# Altium project PCB_WackyRacers.PrjPcb
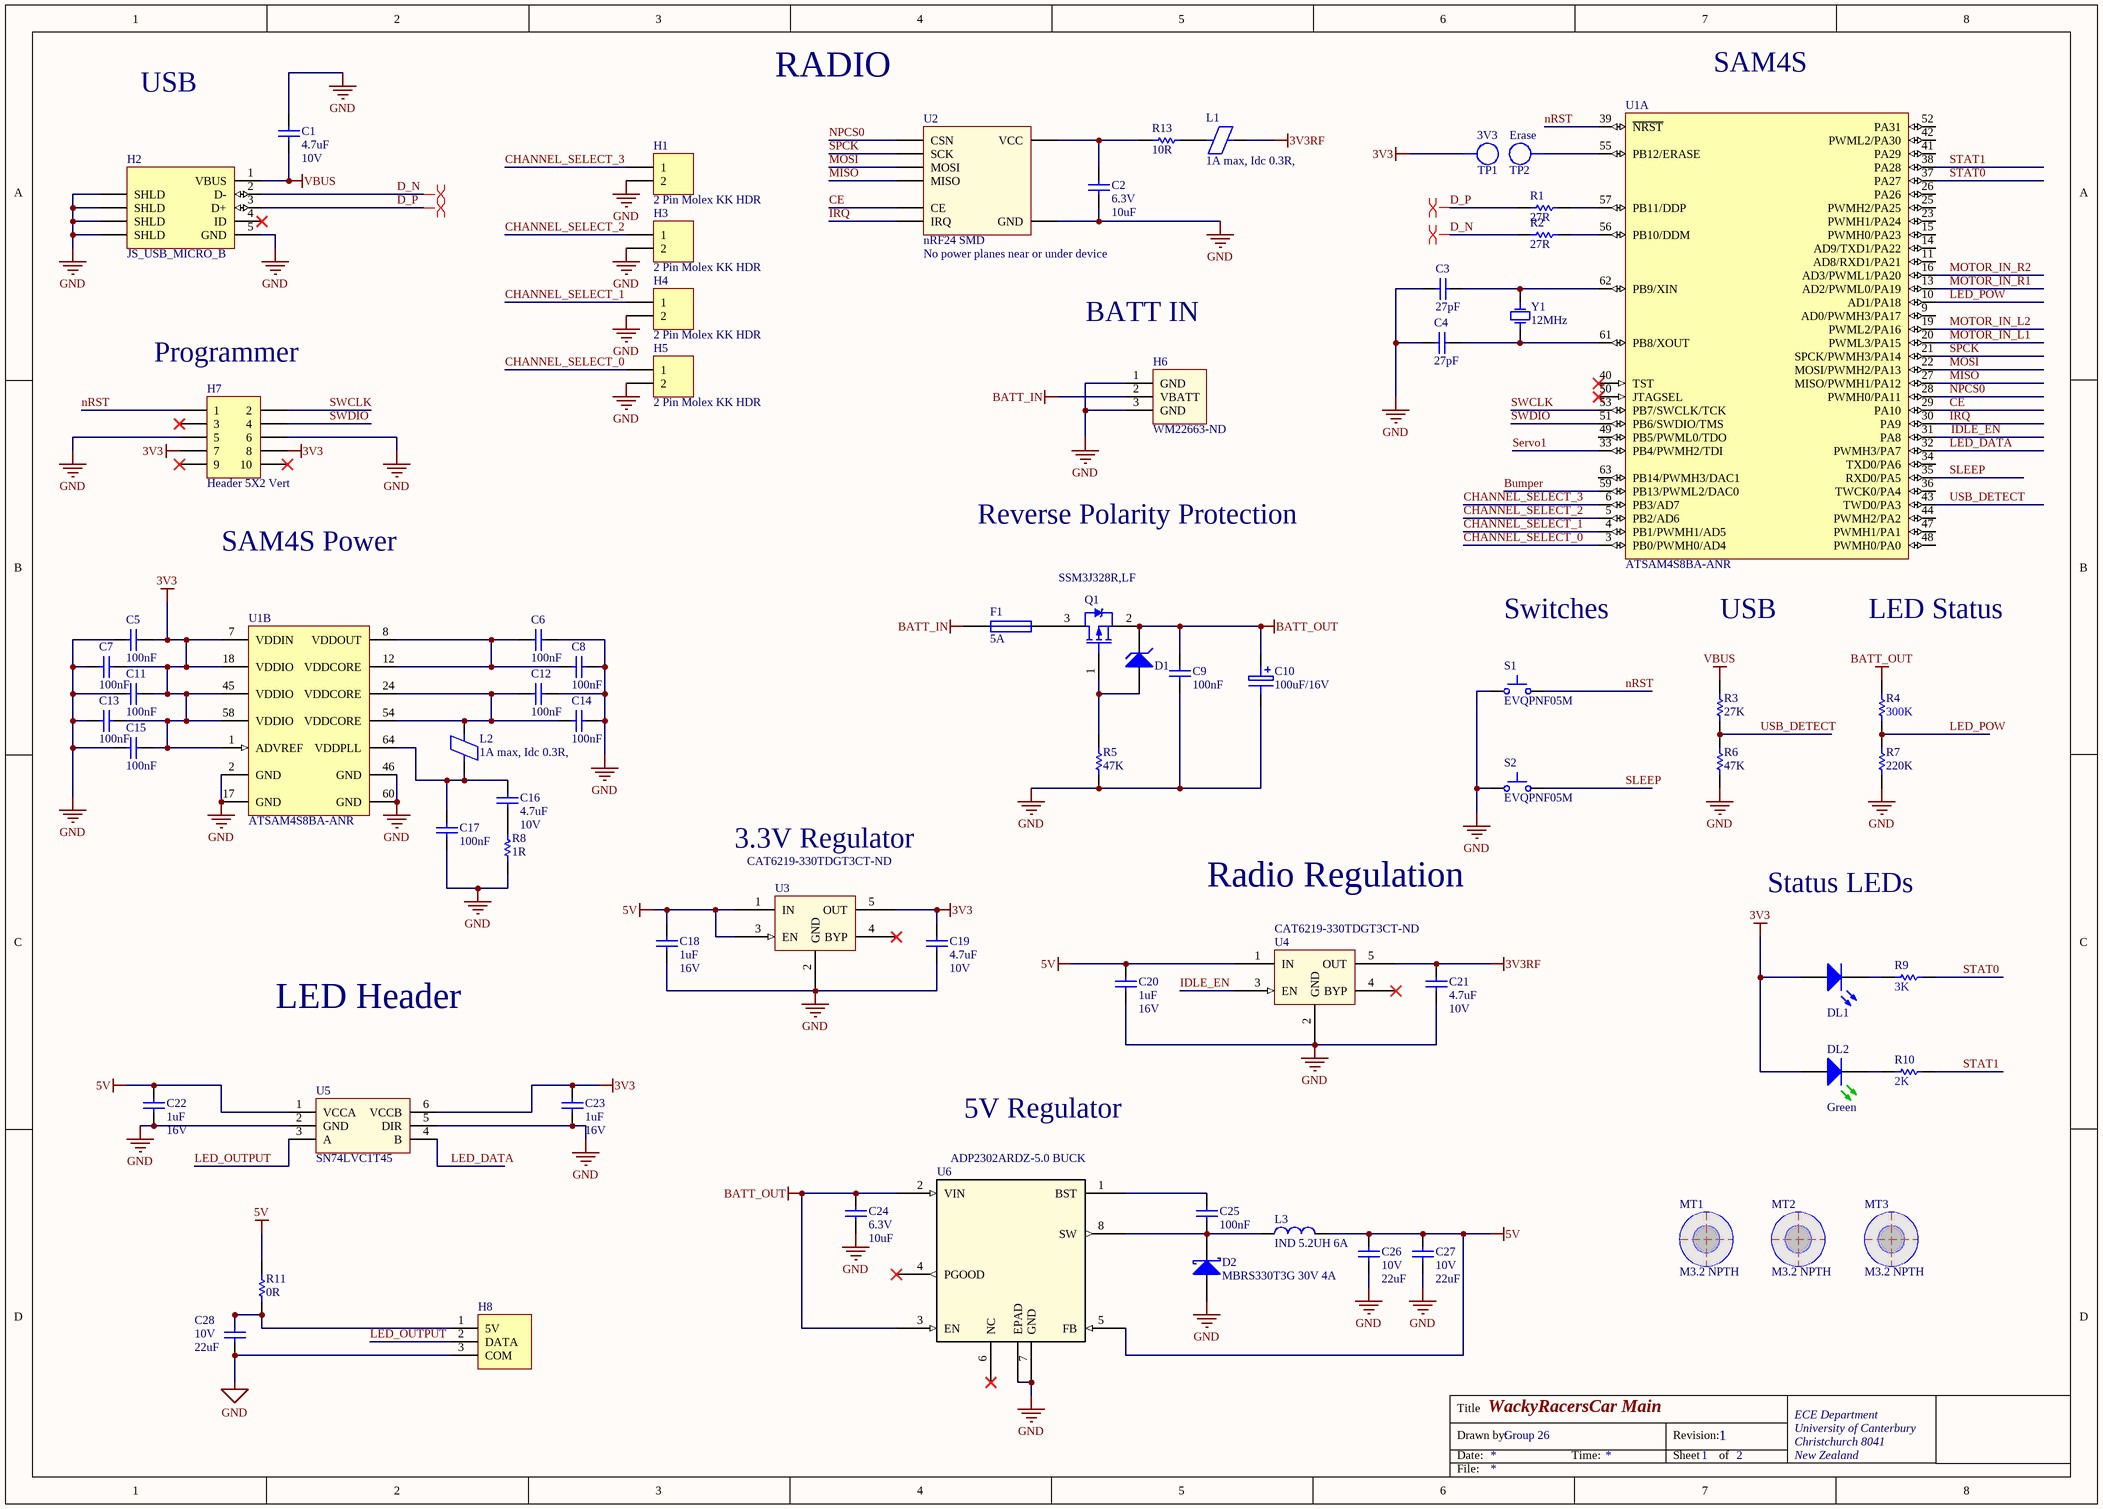
[diagram p0: Schematic_Car_Main.SchDoc]
2 sheets, 98 parts. Net scope: global (net labels, ports and power ports of the same name join across sheets).
Board file: DominicMcNulty_Car_PCB_Group26.PcbDoc
Sheets:
  Schematic_Car_Main.SchDoc
  Schematic_Car_Secondary.SchDoc

## Sheet Schematic_Car_Main.SchDoc: WackyRacersCar Main
size A3; DrawnBy: Group 26; Address1: ECE Department; Address2: University of Canterbury; Address3: Christchurch 8041; Address4: New Zealand; Revision: 1; SheetNumber: 1; SheetTotal: 2; ImagePath: \\maxwell\elecapp\AltiumDesigner\Templates\uc-logo.png

### Parts
C1  Max Voltage: 10V  [CAPC1608N]  (hidden comment: 4.7uF)
C2  Voltage - Rated: 6.3V  [CAPC1608L]  (hidden comment: 10uF)
C3  27pF  [CAPC1608L]
C4  27pF  [CAPC1608L]
C5  100nF  [CAPC1608L]
C6  100nF  [CAPC1608L]
C7  100nF  [CAPC1608L]
C8  100nF  [CAPC1608L]
C9  100nF  [CAPC1608L]
C10  100uF/16V  [NICH-1]
C11  100nF  [CAPC1608L]
C12  100nF  [CAPC1608L]
C13  100nF  [CAPC1608L]
C14  100nF  [CAPC1608L]
C15  100nF  [CAPC1608L]
C16  Max Voltage: 10V  [CAPC1608N]  (hidden comment: 4.7uF)
C17  100nF  [CAPC1608L]
C18  Max Voltage: 16V  [CAPC1608L]  (hidden comment: 1uF)
C19  Max Voltage: 10V  [CAPC1608N]  (hidden comment: 4.7uF)
C20  Max Voltage: 16V  [CAPC1608L]  (hidden comment: 1uF)
C21  Max Voltage: 10V  [CAPC1608N]  (hidden comment: 4.7uF)
C22  Max Voltage: 16V  [CAPC1608L]  (hidden comment: 1uF)
C23  Max Voltage: 16V  [CAPC1608L]  (hidden comment: 1uF)
C24  Voltage - Rated: 6.3V  [CAPC1608L]  (hidden comment: 10uF)
C25  100nF  [CAPC1608L]
C26  Max Voltage: 10V  [CAPC3216L]  (hidden comment: 22uF)
C27  Max Voltage: 10V  [CAPC3216L]  (hidden comment: 22uF)
C28  Max Voltage: 10V  [CAPC3216L]  (hidden comment: 22uF)
D1  DIODE ZENER 5.6V  [DO-214AA_SCL]  (value not drawn)
D2  MBRS330T3G 30V 4A  [SMC]
DL1  DL_LED3mm  [LED3MMTH]  (value not drawn)
DL2  Green  [WL-SMCW0603]
F1  5A  [RESC3216N]
H1  2 Pin Molex KK HDR  [MOLEX_KK_2_HDR]
H2  JS_USB_MICRO_B  [FCI_USB_10118194-0001LF]
H3  2 Pin Molex KK HDR  [MOLEX_KK_2_HDR]
H4  2 Pin Molex KK HDR  [MOLEX_KK_2_HDR]
H5  2 Pin Molex KK HDR  [MOLEX_KK_2_HDR]
H6  Supplier Part Number 1: WM22663-ND  [BATT_HEADER_3POS]  (hidden comment: Battery_HEADER_3pin)
H7  Header 5X2 Vert  [IDC2.54-V10D]
H8  3 Pin Molex KK Hdr  [MOLEX_KK_3_HDR]  (value not drawn)
L1  1A max, Idc 0.3R,  [INDC3216L]
L2  1A max, Idc 0.3R,  [INDC3216L]
L3  IND 5.2UH 6A  [INDUCTOR5u2]
MT1  M3.2 NPTH  [MNT-HOLE_3.2mm_NPTH]  (no BOM)
MT2  M3.2 NPTH  [MNT-HOLE_3.2mm_NPTH]  (no BOM)
MT3  M3.2 NPTH  [MNT-HOLE_3.2mm_NPTH]  (no BOM)
Q1  SSM3J328R,LF  [SOT23_L]
R1  27R  [RESC1608L]
R2  27R  [RESC1608L]
R3  27K  [RESC1608L]
R4  300K  [RESC1608L]
R5  47K  [RESC1608N]
R6  47K  [RESC1608N]
R7  220K  [RESC1608L]
R8  1R  [RESC3216L]
R9  3K  [RESC1608L]
R10  2K  [RESC1608L]
R11  0R  [RESC1608L]
R13  10R  [RESC1608L]
S1  EVQPNF05M  [EVQPNF05M]
S2  EVQPNF05M  [EVQPNF05M]
TP1  3V3  [TP_1206]  (no BOM)
TP2  Erase  [TP_1206]  (no BOM)
U1  ATSAM4S8BA-ANR  [LQFP64_L]  (parts A,B of 2)
U2  nRF24 SMD  Warning: No power planes near or under device  [NRF24]
U3  Supplier Part Number: CAT6219-330TDGT3CT-ND  [SOT95P280X145-5N]  (hidden comment: CAT6219-330TDGT3)
U4  Supplier Part Number: CAT6219-330TDGT3CT-ND  [SOT95P280X145-5N]  (hidden comment: CAT6219-330TDGT3)
U5  SN74LVC1T45  [SOT23-6_N]
U6  ADP2302ARDZ-5.0 BUCK  [RD_8_1]
Y1  12MHz  [6.0X3.5-4]

### Nets
3V3: C5.2 C7.2 C11.2 C13.2 C15.2 C19.2 C23.2 DL1.2(A) DL2.2(A) H7.7 H7.8 TP1.1 U1.1(ADVREF) U1.7(VDDIN) U1.18(VDDIO) U1.45(VDDIO) U1.58(VDDIO) U3.5(OUT) U5.6(VCCB)
3V3RF: C21.2 L1.2 U4.5(OUT)
5V: C18.2 C20.2 C22.2 C26.2 C27.2 L3.2 R11.2 U3.1(IN) U3.3(EN) U4.1(IN) U5.1(VCCA) U6.5(FB)
BATT_IN: F1.1 H6.2(VBATT)
BATT_OUT: C9.2 C10.2 C24.2 D1.1(K) Q1.2 R4.2 U6.2(VIN) U6.3(EN)
GND: C1.2 C2.1 C3.1 C4.1 C5.1 C6.1 C7.1 C8.1 C9.1 C10.1 C11.1 C12.1 C13.1 C14.1 C15.1 C17.1 C18.1 C19.1 C20.1 C21.1 C22.1 C23.1 C24.1 C26.1 C27.1 C28.1 D2.1(A) H1.2 H2.5(GND) H2.6(SHLD) H3.2 H4.2 H5.2 H6.1(GND) H6.3(GND) H7.5 H7.6 H8.3(COM) R5.1 R6.1 R7.1 R8.1 S1.1 S2.1 U1.2(GND) U1.17(GND) U1.46(GND) U1.60(GND) U2.2(GND) U3.2(GND) U4.2(GND) U5.2(GND) U5.5(DIR) U6.7(GND) U6.EPAD
VBUS: C1.1 H2.1(VBUS) R3.2
Bumper: U1.59(PB13/PWML2/DAC0)
CE: U1.29(PA10) U2.3(CE)
CHANNEL_SELECT_0: H5.1 U1.3(PB0/PWMH0/AD4)
CHANNEL_SELECT_1: H4.1 U1.4(PB1/PWMH1/AD5)
CHANNEL_SELECT_2: H3.1 U1.5(PB2/AD6)
CHANNEL_SELECT_3: H1.1 U1.6(PB3/AD7)
D_N: H2.2(D-) R2.1
D_P: H2.3(D+) R1.1
IDLE_EN: U1.31(PA8) U4.3(EN)
IRQ: U1.30(PA9) U2.8(IRQ)
LED_DATA: U1.32(PWMH3/PA7) U5.4(B)
LED_OUTPUT: H8.2(DATA) U5.3(A)
LED_POW: R4.1 R7.2 U1.10(AD1/PA18)
MISO: U1.27(MISO/PWMH1/PA12) U2.7(MISO)
MOSI: U1.22(MOSI/PWMH2/PA13) U2.6(MOSI)
MOTOR_IN_L1: U1.20(PWML3/PA15)
MOTOR_IN_L2: U1.19(PWML2/PA16)
MOTOR_IN_R1: U1.13(AD2/PWML0/PA19)
MOTOR_IN_R2: U1.16(AD3/PWML1/PA20)
NPCS0: U1.28(PWMH0/PA11) U2.4(CSN)
nRST: H7.1 S1.2 U1.39(~{NRST})
Servo1: U1.33(PB4/PWMH2/TDI)
SLEEP: S2.2 U1.35(RXD0/PA5)
SPCK: U1.21(SPCK/PWMH3/PA14) U2.5(SCK)
STAT0: R9.2 U1.37(PA27)
STAT1: R10.2 U1.38(PA28)
SWCLK: H7.2 U1.53(PB7/SWCLK/TCK)
SWDIO: H7.4 U1.51(PB6/SWDIO/TMS)
USB_DETECT: R3.1 R6.2 U1.43(TWD0/PA3)
NetC2_2: C2.2 R13.1 U2.1(VCC)
NetC3_2: C3.2 U1.62(PB9/XIN) Y1.3(OSC2)
NetC4_2: C4.2 U1.61(PB8/XOUT) Y1.1(OSC1)
NetC6_2: C6.2 C8.2 U1.8(VDDOUT) U1.12(VDDCORE)
NetC12_2: C12.2 C14.2 L2.2 U1.24(VDDCORE) U1.54(VDDCORE)
NetC16_1: C16.1 R8.2
NetC16_2: C16.2 C17.2 L2.1 U1.64(VDDPLL)
NetC25_1: C25.1 D2.2(K) L3.1 U6.8(SW)
NetC25_2: C25.2 U6.1(BST)
NetC28_2: C28.2 H8.1(5V) R11.1
NetD1_2: D1.2(A) Q1.1 R5.2
NetDL1_1: DL1.1(K) R9.1
NetDL2_1: DL2.1(K) R10.1
NetF1_2: F1.2 Q1.3
NetL1_1: L1.1 R13.2
NetR1_2: R1.2 U1.57(PB11/DDP)
NetR2_2: R2.2 U1.56(PB10/DDM)
NetTP2_1: TP2.1 U1.55(PB12/ERASE)

Not connected (* = marked no-connect by the designer): H2 4(ID)*; H7 3* 9* 10*; U1 9(AD0/PWMH3/PA17) 11(AD8/RXD1/PA21) 14(AD9/TXD1/PA22) 15(PWMH0/PA23) 23(PWMH1/PA24) 25(PWMH2/PA25) 26(PA26) 34(TXD0/PA6) 36(TWCK0/PA4) 40(TST)* 41(PA29) 42(PWML2/PA30) 44(PWMH2/PA2) 47(PWMH1/PA1) 48(PWMH0/PA0) 49(PB5/PWML0/TDO) 50(JTAGSEL)* 52(PA31) 63(PB14/PWMH3/DAC1); U3 4(BYP)*; U4 4(BYP)*; U6 4(PGOOD)* 6(NC)*

### Layout directives
differential pair: D_N, D_P

### Notes on the sheet
- USB
- RADIO
- (near U1) SAM4S
- (near H7) Programmer
- BATT IN
- SAM4S Power
- Reverse Polarity Protection
- Switches
- LED Status
- 3.3V Regulator
- Radio Regulation
- Status LEDs
- LED Header
- 5V Regulator
- Title
- Drawn by:
- Date:
- Time:
- Revision:
- Sheet
- of
- File:

### Library data of the parts
C1 C16 C19 C21 = CC_4.7uF_0603: CAP CER 4.7uF X5R +-20%  10V 0603; Note: Footprint corresponds to dimensions for bulk cassette packaging. This case size has tightened tolerances.; PackageReference: 0805; Code_IPC: 2012[0805]; Verify: *; Supplier: ECE Dept; Storage Location: PCB Assembly WS; Value: 4.7uF
C2 C24 = CC_10uF_0603: CAP CER 10UF X5R +-20% 6V3 0603; Supplier: ECE Dept; Storage Location: PCB Assembly WS; Value: 10uF
C3 C4 = CC_27pF_0603: CAP CER 27pF NPO/COG +-5% 50V 0603; PackageReference: 0603; Code_IPC: 1608 [0603]; Verify: *; Supplier: ECE Dept; Storage Location: PCB Assembly WS; Value: 27pF
C5-C9 C11-C15 C17 C25 = CC_100nF_0603: CAP CER 100nF X7R +-10% 50V 0603; PackageReference: 0603; Code_IPC: 1608 [0603]; Verify: *; Supplier: ECE Dept; Storage Location: PCB Assembly WS; Value: 100nF
C10 = CA_100uF_16V: CAP ALUM 100uF 16V SMD; Manufacturer PN: UWX1C101MCL1GB; Manufacturer: Nichcon; Supplier 1: Farnell; Supplier Part Number 1: 1870677; Storage Location: PCB Assembly WS; Supplier: ECE Dept; Supplier 2: Digi-Key; Supplier Part Number 2: 493-2105-1-ND; Value: 100uF/16V
C18 C20 C22 C23 = CC_1uF_0603: CAP CER 1uF Y5V -20% +80% 16V 0603; PackageReference: 0603; Code_IPC: 1608 [0603]; Verify: *; Supplier: ECE Dept; Storage Location: PCB Assembly WS; Value: 1uF
C26-C28 = CC_22uF_1206: CAP CER 22uF Y5V -20% +80% 10V 1206; Verify: *; Supplier: ECE Dept; Storage Location: PCB Assembly WS; Dielectric: Y5V; Footprint: 1206 (3216 metric); Value: 22uF
D1 = SMBJ5339B-TP: DIODE ZENER 5.6V 5W DO214AA; Manufacturer: Micro Commercial Co; Tolerance: ±5%; Supplier 1: Digi-Key; Manufacturer Part Number: SMBJ5339B-TP; RoHS: RoHS Compliant; Category: Discrete Semiconductor Products; Stock 1: 85990; Pricing 1: 1=1.47, 10=1.277, 25=1.1312, 100=0.9853, 250=0.85764, 500=0.72988, 1000=0.58391 (NZD); Packaging: Cut Tape (CT); Part Status: Active; Operating Temperature: -55°C ~ 150°C; Mounting Type: Surface Mount; Package / Case: DO-214AA, SMB; Supplier Device Package: DO-214AA (SMB); Base Part Number: SMBJ5339; ComponentLink1URL: http://www.mccsemi.com/up_pdf/SMBJ5338B-SMBJ5388B(SMB).pdf; ComponentLink1Description: http://www.mccsemi.com/up_pdf/SMBJ5338B-SMBJ5388B(SMB).pdf; Supplier Part Number 1: SMBJ5339B-TPMSCT-ND
D2 = MBRS330T3G: SCHOTTKY  30V 4A; Manufacturer: ON Semiconductor; Speed: Fast Recovery =< 500ns, > 200mA (Io); Supplier 1: Digi-Key; Manufacturer Part Number: MBRS330T3G; RoHS: RoHS Compliant; Category: Discrete Semiconductor Products; Stock 1: 8919; Pricing 1: 1=0.93, 10=0.79, 100=0.5902, 500=0.46368, 1000=0.35829 (NZD); Packaging: Cut Tape (CT); Part Status: Active; Diode Type: Schottky; Current - Average Rectified (Io): 4A; Capacitance @ Vr, F: -; Mounting Type: Surface Mount; Package / Case: DO-214AB, SMC; Supplier Device Package: SMC; Operating Temperature - Junction: -65°C ~ 150°C; Base Part Number: MBRS330; ComponentLink1URL: http://www.onsemi.com/pub/Collateral/MBRS340T3-D.PDF; ComponentLink1Description: http://www.onsemi.com/pub/Collateral/MBRS340T3-D.PDF; Supplier Part Number 1: MBRS330T3GOSCT-ND
DL1 = DL_LED3mm: LED 3mm Dia Thru Hole; Storage Location: ECE Store; Supplier 1: Farnell; Supplier Part Number 1: 1497967; Supplier: ECE Dept
DL2 = DL_150060GS75000: LED Green 430mcd 0603 SMD; Manufacturer: WURTH ELEKTRONIK; Forward Current If: 30; Wavelength Typ: 520; Forward Voltage: 3.2; Lens Shape: Rectangular; Luminous Intensity: 430; Viewing Angle: 140°; LED Mounting: SMD; Supplier 1: Farnell; Supplier Part Number 1: 2322070; Manufacturer Part Number: 150060GS75000; Storage Location: PCB Assembly WS; Supplier: ECE Dept; LED Colour: Green
F1 = FS_Fuse_5.0A: Fuse 5.0A Fast Acting 1206 SMD; Manufacturer Part Number: C1F5; Manufacturer: Bel TRP; Voltage Rating (AC): 125V; Voltage Rating (DC): 63V; DC Cold Resistance: 19mR; Fuse Type: Board Mount (Cartridge Style Excluded); Approvals: CE,cURus; Mount: Surface Mount; Case/Package: 1206; Number of Pins: 2; Case Code (Metric): 3216; Case Code (Imperial): 1206; Contact Plating: Nickel,Tin; Min Operating Temperature: -55°C; Max Operating Temperature: 125°C; Packaging: Tape and Reel; Voltage Rating: 125V; Length: 0.126inch; Width: 0.062inch; Supplier 1: Digi-Key; Stock 1: 725; Pricing 1: 1=0.32, 5=0.312, 10=0.298, 50=0.2662, 100=0.2479, 250=0.22032, 500=0.1836, 1000=0.17442 (USD); ComponentLink1URL: http://www.farnell.com/datasheets/2571625.pdf; ComponentLink1Description: http://www.farnell.com/datasheets/2571625.pdf; ComponentLink2URL: http://belfuse.com/pdfs/C1F.pdf; ComponentLink2Description: http://belfuse.com/pdfs/C1F.pdf; ComponentLink3URL: http://www.mouser.com/ds/2/643/C1F-594910.pdf; ComponentLink3Description: http://www.mouser.com/ds/2/643/C1F-594910.pdf; ComponentLink4URL: https://belfuse.com/resources/StewartConnector/C1F.pdf; ComponentLink4Description: https://belfuse.com/resources/StewartConnector/C1F.pdf; Current Rating: 5A; Supplier Part Number 1: 507-1886-1-ND; Supplier 2: Element14; Supplier Part Number 2: 2848595; Value: 5A
H1 H3-H5 = JA_MOLEX_KK_2POS: CONN HEADER 2POS 2.54mm VERT_Thru Hole; Supplier 1: Farnell; Supplier Part Number 1: 1462926; Supplier: ECE Dept; Storage Location: ECE Dept Store; Value: 2 Pin Molex KK HDR
H2 = JS_USB_MICRO_B_SMT: CONN USB MICRO B RECPT SMT R/A; Manufacturer: FCI; Manufacturer Part Number: 10118194-0001LF; Gender: Receptacle; Number of Contacts: 5; Specifications: USB 2.0; Supplier 1: Digi-Key; Supplier Part Number 1: 609-4618-1-ND; Features: Shielded, Solder Retention; Mounting Type: Surface Mount, Right Angle, Horizontal
H6 = Battery_HEADER_3pin: 3Pin Header 2.54mm spacing / Digikey #WM22663-ND; Supplier 1: Digi-Key
H7 = JA_HDR_IDC_5X2_VERT: IDC Header, 2,54mm, 10-Pin, Vert; Supplier: ECE Dept; Supplier 1: Farnell; Supplier Part Number 1: 1096985; Storage Location: ECE Dept Store
H8 = LED_Strip_Header: CONN HEADER 3POS 2.54mm VERT_Thru Hole; Manufacturer: Molex; Manufacturer PN: 22-23-2031; Supplier Part Number 1: 9731156; Supplier: ECE Dept; Supplier 1: Farnell; Storage Location: ECE Dept Store; Value: 3 Pin Molex KK Hdr
L1 L2 = IN_Ferrite-Bead: Ferrite Bead, Rdc 0.3R, Z100MHZ 600R, Imax 1A, SMD 1206; Manufacturer: FAIR-RITE; Manufacturer PN: 2512066017Y1; DC Current Rating: 1; DC Resistance Max: 0.08; Ferrite Case Style: 1206 ^3216 Metric]; Frequency Range: 50MHz to 1; Impedance: 600; Impedance Tolerance: ± 25%; Supplier: ECE Dept; Storage Location: PCB Assembly WS; Ferrite Mounting: SMD; Supplier 1: Farnell; Supplier Part Number 1: 1612060; Manufacturer Part Number: 2512066017Y1; Value: 1A max, Idc 0.3R,
L3 = CDRH104RNP-5R2NC: FIXED IND 5.2UH 6A 22 MOHM SMD; Manufacturer: Sumida America Components Inc.; Material - Core: Ferrite; Tolerance: ±30%; Current - Saturation: 5.6A; Shielding: Shielded; DC Resistance (DCR): 22 mOhm Max; Supplier 1: Digi-Key; Manufacturer Part Number: CDRH104RNP-5R2NC; RoHS: RoHS Compliant; Category: Inductors, Coils, Chokes; Stock 1: 3849; Pricing 1: 1=2.9, 10=2.678, 100=1.8743, 500=1.5173 (NZD); Packaging: Cut Tape (CT); Part Status: Active; Type: -; Q @ Freq: -; Frequency - Self Resonant: -; Ratings: -; Operating Temperature: -40°C ~ 100°C; Mounting Type: Surface Mount; Package / Case: Nonstandard; Supplier Device Package: -; Size / Dimension: 0.402" L x 0.394" W (10.20mm x 10.00mm); Height - Seated (Max): 0.157" (4.00mm); ComponentLink1URL: http://products.sumida.com/products/pdf/CDRH104R.pdf; ComponentLink1Description: http://products.sumida.com/products/pdf/CDRH104R.pdf; Supplier Part Number 1: 308-2280-1-ND
MT1-MT3 = MC_M3.2_HOLE: Fixing M3.2 Mount Hole NPTH; Manufacturer: Hi-Q; Manufacturer PN: 3BV series M3 Clearance; price: 0; Supplier: ECE Dept; value: M3.2 NPTH
Q1 = TM_SSM3J328R: MOSFET P-CH 20V 6A SOT23-3; Manufacturer: Toshiba; FET Feature: Logic Level Gate, 1.5V Drive; FET Type: MOSFET P-Channel, Metal Oxide; Gate Charge (Qg) @ Vgs: 12.8nC @ 4.5V; Input Capacitance (Ciss) @ Vds: 840pF @ 10V; Power - Max: 1W; Rds On Max: 29.8mR; Drain to Source Resistance: 47.4mR; Turn-On Delay Time: 32ns; Power Dissipation: 2W; Number of Channels: 1; Turn-Off Delay Time: 107ns; Gate to Source Voltage (Vgs): 8V; Input Capacitance: 840pF; Element Configuration: Single; Drain to Source Breakdown Voltage: -20V; Vgs(th) (Max) @ Id: 1V @ 1mA; Current - Continuous Drain (Id) @ 25° C: 6A; Drain to Source Voltage (Vdss): 20V; Package / Case: SOT-23-3 Flat Leads; Supplier Device Package: SOT-23F; Pricing: 1=0.79, 10=0.658, 25=0.5772, 100=0.4939, 250=0.42836, 500=0.36284, 1000=0.27972 (NZD); Storage Location: PCB Assembly WS; Supplier: Digi-Key; ComponentLink1URL: https://datasheet.ciiva.com/11158/ssm3j328r-datasheet-en-20140301-11158652.pdf; ComponentLink1Description: https://datasheet.ciiva.com/11158/ssm3j328r-datasheet-en-20140301-11158652.pdf; Supplier Part Number: SSM3J328RLFDKR-ND; Max Operating Temperature: 150°C; Mount: Surface Mount; Packaging: Tape and Reel; Min Operating Temperature: -55°C; Continuous Drain Current (ID): 6A; Radiation Hardening: No; Max Power Dissipation: 1W; Package Quantity: 3000; Case/Package: SOT-23-3; Number of Pins: 3; Number of Elements: 1; Supplier 1: Digi-Key; Supplier Part Number 1: SSM3J328RLFDKR-ND; Manufacturer Part Number: SSM3J328R,LF
R1 R2 = RS_27R: RES 27 OHM 1/10W 5% 0603 SMD; Storage Location: PCB Assembly WS; Supplier: ECE Dept; Value: 27R
R3 = RS_27K: RES 27K OHM 1/10W 5% 0603 SMD; Storage Location: PCB Assembly WS; Supplier: ECE Dept; Value: 27K
R4 = RS_300K: RES 300K OHM 1/10W 5% 0603 SMD; Storage Location: PCB Assembly WS; Supplier: ECE Dept; Value: 300K
R5 R6 = RS_47K: RES 47.0K OHM 1/10W 5% 0603 SMD; Storage Location: PCB Assembly WS; Supplier: ECE Dept; Value: 47K
R7 = RS_220K: RES 3.3K OHM 1/10W 5% 0603 SMD; Storage Location: PCB Assembly WS; Supplier: ECE Dept; Value: 220K
R8 = RT_1R: RES 1R OHM 1/4W 5% 1206 SMD; Storage Location: PCB Assembly WS; Supplier: ECE Dept; Value: 1R
R9 = RS_3K: RES 3K OHM 1/10W 5% 0603 SMD; Storage Location: PCB Assembly WS; Supplier: ECE Dept; Value: 3K
R10 = RS_2K: RES 2K OHM 1/10W 5% 0603 SMD; Storage Location: PCB Assembly WS; Supplier: ECE Dept; Value: 2K
R11 = RS_0R0: RES 0.0 OHM 1/10W 5% 0603 SMD; Storage Location: PCB Assembly WS; Supplier: ECE Dept; Value: 0R
R13 = RS_10R: RES 10 OHM 1/10W 5% 0603 SMD; Storage Location: PCB Assembly WS; Supplier: ECE Dept; Value: 10R
S1 S2 = WS_EVQPNF05M: Panasonic 6 x 3.5mm SMD Light Touch Switch Type SMD; PackageDescription: 6.0 x 3.5 mm; Supplier 1: Farnell; Supplier Part Number 1: 2079481; Manufacturer: Panasonic; Manufacturer PN: EVQPNF05M; Supplier 2: Digi-Key; Supplier Part Number 2: P13598SCT-ND; Storage Location: PCB Assembly WS; Supplier: ECE Dept
TP1 TP2 = TP_1206: Test-Point 3.3x1.6x2.1mm SMD; Manufacturer: Harwin Inc; Manufacturer Part Number: S1751-46R; Value: TP; Manufacturer PN: *; Storage Location: ProtoPlace; Mounting Type: Surface Mount; Type: PC Test Point; Supplier 1: Digi-Key; Supplier Part Number 1: 952-1478-2-ND; Supplier 2: Farnell; Supplier Part Number 2: 1826282; Supplier: ECE Dept
U1 = SE_ATSAM4S16BA-MU: IC MCU 32BIT 512KB FLASH 64LQFP; Manufacturer: Atmel; Connectivity: I²C, IrDA, Memory Card, SPI, SSC, UART/USART, USB; Core Processor: ARM® Cortex®-M4; Core Size: 32-Bit; Data Converters: A/D 11x12b, D/A 2x12b; Number of I/O: 47; Peripherals: Brown-out Detect/Reset, DMA, POR, PWM, WDT; Program Memory Size: 512KB (512K x 8); RAM Size: 128K x 8; Speed: 120MHz; Voltage - Supply (Vcc/Vdd): 1.62 V ~ 3.6 V; PackageVersion: revJ, Jul-2007; PackageReference: 64PS; PackageDescription: 64-Pin Quad Flat No-Lead (QFN) Sawn, 9 x 9 x 1.0 mm Body, 0.5 mm Pitch, Exposed Pad; Code_JEDEC: MO-220VMMD-3; ComponentLink1Description: Manufacturer URL; ComponentLink1URL: http://www.atmel.com/; ComponentLink2Description: SAM4S Series Datasheet; ComponentLink2URL: http://www.atmel.com/dyn/resources/prod_documents/11100.pdf; ComponentLink3Description: SAM4S Series Summary; ComponentLink3URL: http://www.atmel.com/dyn/resources/prod_documents/11100S.pdf; Supplier 1: Digi-Key; Package / Case: 64-LQFP; Packaging: Cut Tape (CT); Program Memory Type: FLASH; Supplier Part Number 1: ATSAM4S8BA-ANRCT-ND; Manufacturer Part Number: ATSAM4S8BA-ANR
U2 = NRF24: nRF24 SMD Module
U3 U4 = SV_CAT6219-330TDGT3: IC REG LIN 3.3V 500MA TSOT23-5; Voltage - Input (Max): 5.5V; Voltage Dropout (Max): 0.5V @ 500mA; Manufacturer Part Number: CAT6219-330TDGT3; Base Part Number: CAT6219; Current - Output: 500mA; Package / Case: SOT-23-5 Thin, TSOT-23-5; Supplier: Digi-Key; Supplier Device Package: TSOT-23-5; Voltage - Output (Min/Fixed): 3.3V; ComponentLink1URL: http://www.onsemi.com/pub/Collateral/CAT6219-D.PDF; ComponentLink1Description: http://www.onsemi.com/pub/Collateral/CAT6219-D.PDF; Supplier 1: Digi-Key; ComponentLink2Description: CAT6219 Datasheet; ComponentLink2URL: \\maxwell\elecapp\AltiumDesigner\Libraries\DatasheetsNew\ENCE461\CAT6219-D.PDF
U5 = SN74LVC1T45: 1.8V - 5V level converter
U6 = ADP2302ARDZ-5.0-R7: IC REG BUCK 5V 2A 8SOIC; Vendor: Analog Devices Inc; Frequency - Switching: 700kHz; Output Type: Fixed; Voltage - Input (Max): 20V; Manufacturer_Part_Number: ADP2302ARDZ-5.0-R7; Type: DEV; Value: Value; Supplier 1: Digi-Key; Current - Output: 2A; Voltage - Output (Min/Fixed): 5V; Supplier Part Number 1: ADP2302ARDZ-5.0-R7CT-ND; ComponentLink1Description: ADP2302ARDZ-5.0 Datasheet; ComponentLink1URL: \\maxwell\elecapp\AltiumDesigner\Libraries\DatasheetsNew\ENCE461\ADP2302_2303.pdf
Y1 = XT_CRYSTAL_12MHz_18pF: CRYSTAL 12MHZ 18PF 6X3.5mm SMD; Manufacturer: CTS-Frequency Controls; Manufacturer Part Number: 406C35D12M00000; ESR (Equivalent Series Resistance): 60 Ohm; Frequency Stability: ±50ppm; Frequency Tolerance: ±30ppm; Operating Mode: Fundamental; Supplier 1: Digi-Key; Height: 0.047" (1.20mm); Load Capacitance: 18pF; Mounting Type: Surface Mount; Operating Temperature: -20°C ~ 70°C; Package / Case: 4-SMD, No Lead (DFN, LCC); Size / Dimension: 0.236" L x 0.138" W (6.00mm x 3.50mm); Supplier Part Number 1: CTX855CT-ND; Frequency: 12MHz

## Sheet Schematic_Car_Secondary.SchDoc: WackyRacersCar Secondary
size A3; DrawnBy: Group 26; Address1: ECE Department; Address2: University of Canterbury; Address3: Christchurch 8041; Address4: New Zealand; Revision: 1; SheetNumber: 2; SheetTotal: 2; ImagePath: \\maxwell\elecapp\AltiumDesigner\Templates\uc-logo.png
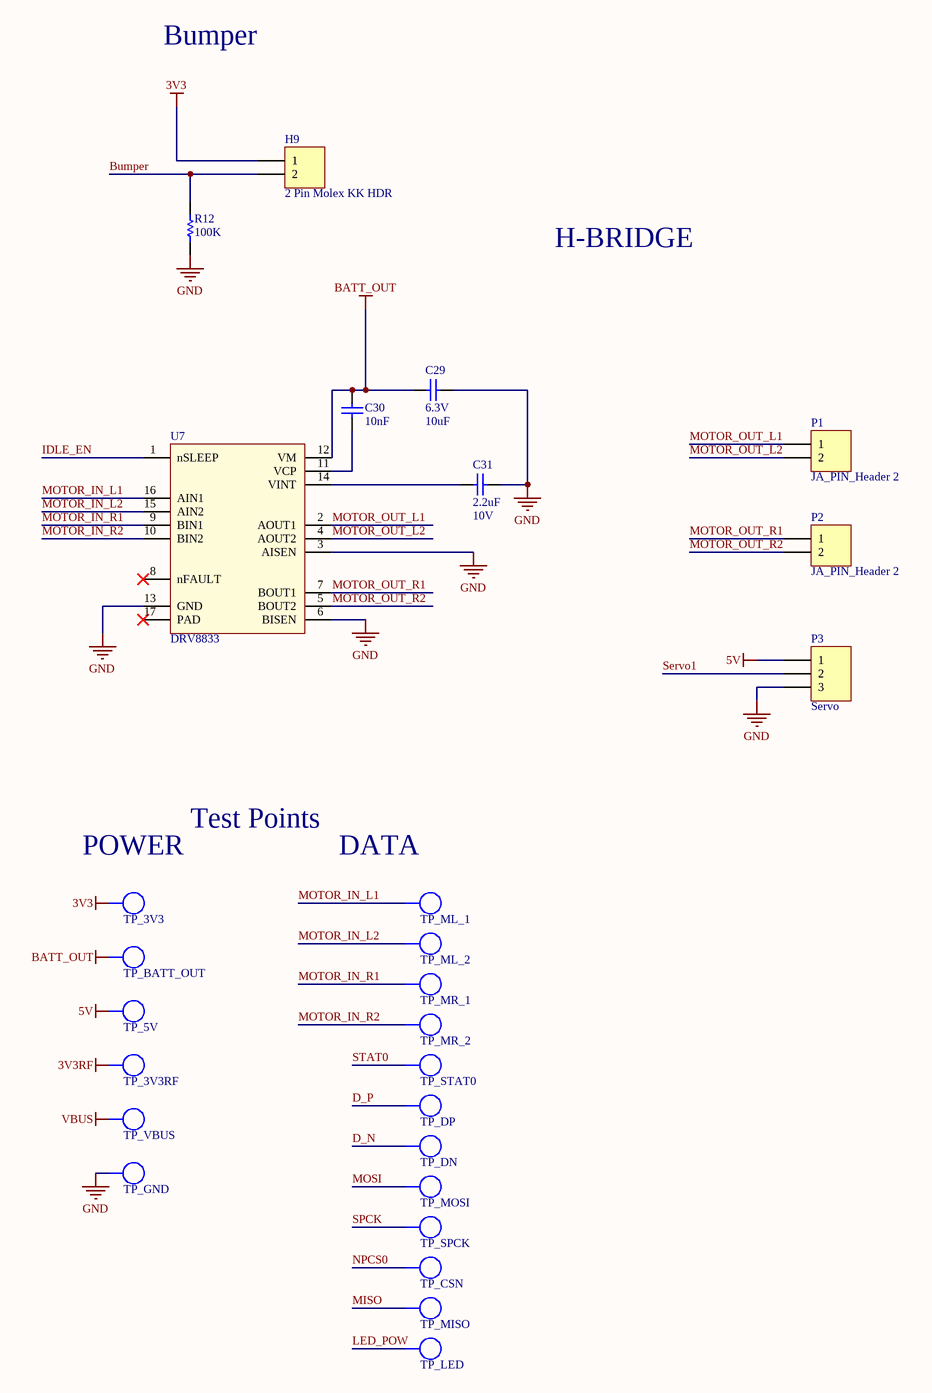
[diagram p1: Schematic_Car_Secondary.SchDoc]

### Parts
C29  Voltage - Rated: 6.3V  [CAPC1608L]  (hidden comment: 10uF)
C30  10nF  [CAPC1608L]
C31  Max Voltage: 10V  [CAPC1608L]  (hidden comment: 2.2uF)
H9  2 Pin Molex KK HDR  [MOLEX_KK_2_HDR]
P1  JA_PIN_Header 2  [HDR1X2]
P2  JA_PIN_Header 2  [HDR1X2]
P3  Servo  [HDR1X3]
R12  100K  [RESC1608L]
TP_3V3  3V3  [TP_1206]  (value not drawn)  (no BOM)
TP_3V3RF  3V3RF  [TP_1206]  (value not drawn)  (no BOM)
TP_5V  5V  [TP_1206]  (value not drawn)  (no BOM)
TP_BATT_OUT  BATT_OUT  [TP_1206]  (value not drawn)  (no BOM)
TP_CSN  CSN  [TP_1206]  (value not drawn)  (no BOM)
TP_DN  DN  [TP_1206]  (value not drawn)  (no BOM)
TP_DP  DP  [TP_1206]  (value not drawn)  (no BOM)
TP_GND  GND  [TP_1206]  (value not drawn)  (no BOM)
TP_LED  LED  [TP_1206]  (value not drawn)  (no BOM)
TP_MISO  MISO  [TP_1206]  (value not drawn)  (no BOM)
TP_ML_1  L1  [TP_1206]  (value not drawn)  (no BOM)
TP_ML_2  L2  [TP_1206]  (value not drawn)  (no BOM)
TP_MOSI  MOSI  [TP_1206]  (value not drawn)  (no BOM)
TP_MR_1  R1  [TP_1206]  (value not drawn)  (no BOM)
TP_MR_2  R2  [TP_1206]  (value not drawn)  (no BOM)
TP_SPCK  SPCK  [TP_1206]  (value not drawn)  (no BOM)
TP_STAT0  STAT0  [TP_1206]  (value not drawn)  (no BOM)
TP_VBUS  VBUS  [TP_1206]  (value not drawn)  (no BOM)
U7  DRV8833  [HTSOP16 DRV8833]

### Nets
3V3: H9.1 TP_3V3.1
3V3RF: TP_3V3RF.1
5V: P3.1 TP_5V.1
BATT_OUT: C29.1 C30.2 TP_BATT_OUT.1 U7.12(VM)
GND: C29.2 C31.1 P3.3 R12.1 TP_GND.1 U7.3(AISEN) U7.6(BISEN) U7.13(GND)
VBUS: TP_VBUS.1
Bumper: H9.2 R12.2
D_N: TP_DN.1
D_P: TP_DP.1
IDLE_EN: U7.1(nSLEEP)
LED_POW: TP_LED.1
MISO: TP_MISO.1
MOSI: TP_MOSI.1
MOTOR_IN_L1: TP_ML_1.1 U7.16(AIN1)
MOTOR_IN_L2: TP_ML_2.1 U7.15(AIN2)
MOTOR_IN_R1: TP_MR_1.1 U7.9(BIN1)
MOTOR_IN_R2: TP_MR_2.1 U7.10(BIN2)
MOTOR_OUT_L1: P1.1 U7.2(AOUT1)
MOTOR_OUT_L2: P1.2 U7.4(AOUT2)
MOTOR_OUT_R1: P2.1 U7.7(BOUT1)
MOTOR_OUT_R2: P2.2 U7.5(BOUT2)
NPCS0: TP_CSN.1
Servo1: P3.2
SPCK: TP_SPCK.1
STAT0: TP_STAT0.1
NetC30_1: C30.1 U7.11(VCP)
NetC31_2: C31.2 U7.14(VINT)

Not connected (* = marked no-connect by the designer): U7 8(nFAULT)* 17(PAD)*

### Notes on the sheet
- Bumper
- H-BRIDGE
- (near TP_3V3) POWER
- Test Points
- (near TP_ML_1) DATA
- Title
- Drawn by:
- Date:
- Time:
- Revision:
- Sheet
- of
- File:

### Library data of the parts
C29 = CC_10uF_0603: CAP CER 10UF X5R +-20% 6V3 0603; Supplier: ECE Dept; Storage Location: PCB Assembly WS; Value: 10uF
C30 = CC_10nF_0603: CAP CER 10nF X7R +-10% 50V 0603; PackageReference: 0603; Code_IPC: 1608 [0603]; Verify: *; Supplier: ECE Dept; Storage Location: PCB Assembly WS; Value: 10nF
C31 = CC_2.2uF_0603: CAP CER 2.2uF X5R +-20% 10V 0603; PackageReference: 0603; Code_IPC: 1608 [0603]; Verify: *; Supplier: ECE Dept; Storage Location: PCB Assembly WS; Value: 2.2uF
H9 = JA_MOLEX_KK_2POS: CONN HEADER 2POS 2.54mm VERT_Thru Hole; Supplier 1: Farnell; Supplier Part Number 1: 1462926; Supplier: ECE Dept; Storage Location: ECE Dept Store; Value: 2 Pin Molex KK HDR
P1 P2 = JA_PIN_Header 2: Header, 2-Pin; LatestRevisionDate: 17-Jul-2002; LatestRevisionNote: Re-released for DXP Platform.; Publisher: Altium Limited
P3 = JA_PIN_Header 3: Header, 3-Pin; LatestRevisionDate: 17-Jul-2002; LatestRevisionNote: Re-released for DXP Platform.; Publisher: Altium Limited
R12 = RS_100K: RES 100K OHM 1/10W 5% 0603 SMD; Storage Location: PCB Assembly WS; Supplier: ECE Dept; Value: 100K
TP_3V3 TP_3V3RF TP_5V TP_BATT_OUT TP_CSN TP_DN TP_DP TP_GND TP_LED TP_MISO TP_ML_1 TP_ML_2 TP_MOSI TP_MR_1 TP_MR_2 TP_SPCK TP_STAT0 TP_VBUS = TP_1206: as TP1 on sheet Schematic_Car_Main; Manufacturer PN: *; Storage Location: ProtoPlace; Mounting Type: Surface Mount; Type: PC Test Point; Supplier 1: Digi-Key; Supplier Part Number 1: 952-1478-2-ND; Supplier 2: Farnell; Supplier Part Number 2: 1826282; Supplier: ECE Dept
U7 = DRV8833: Dual H-Bridge Motor Driver 1.5A; ComponentLink1Description: DRV8833 Datasheet; ComponentLink1URL: \\maxwell\elecapp\AltiumDesigner\Libraries\DatasheetsNew\ENCE461\drv8833pwpr.pdf

## Nets that join several sheets
3V3: Schematic_Car_Main (19 pins), Schematic_Car_Secondary (H9.1 TP_3V3.1)
3V3RF: Schematic_Car_Main (C21.2 L1.2 U4.5), Schematic_Car_Secondary (TP_3V3RF.1)
5V: Schematic_Car_Main (12 pins), Schematic_Car_Secondary (P3.1 TP_5V.1)
BATT_OUT: Schematic_Car_Main (8 pins), Schematic_Car_Secondary (C29.1 C30.2 TP_BATT_OUT.1 U7.12)
GND: Schematic_Car_Main (55 pins), Schematic_Car_Secondary (8 pins)
VBUS: Schematic_Car_Main (C1.1 H2.1 R3.2), Schematic_Car_Secondary (TP_VBUS.1)
Bumper: Schematic_Car_Main (U1.59), Schematic_Car_Secondary (H9.2 R12.2)
D_N: Schematic_Car_Main (H2.2 R2.1), Schematic_Car_Secondary (TP_DN.1)
D_P: Schematic_Car_Main (H2.3 R1.1), Schematic_Car_Secondary (TP_DP.1)
IDLE_EN: Schematic_Car_Main (U1.31 U4.3), Schematic_Car_Secondary (U7.1)
LED_POW: Schematic_Car_Main (R4.1 R7.2 U1.10), Schematic_Car_Secondary (TP_LED.1)
MISO: Schematic_Car_Main (U1.27 U2.7), Schematic_Car_Secondary (TP_MISO.1)
MOSI: Schematic_Car_Main (U1.22 U2.6), Schematic_Car_Secondary (TP_MOSI.1)
MOTOR_IN_L1: Schematic_Car_Main (U1.20), Schematic_Car_Secondary (TP_ML_1.1 U7.16)
MOTOR_IN_L2: Schematic_Car_Main (U1.19), Schematic_Car_Secondary (TP_ML_2.1 U7.15)
MOTOR_IN_R1: Schematic_Car_Main (U1.13), Schematic_Car_Secondary (TP_MR_1.1 U7.9)
MOTOR_IN_R2: Schematic_Car_Main (U1.16), Schematic_Car_Secondary (TP_MR_2.1 U7.10)
NPCS0: Schematic_Car_Main (U1.28 U2.4), Schematic_Car_Secondary (TP_CSN.1)
Servo1: Schematic_Car_Main (U1.33), Schematic_Car_Secondary (P3.2)
SPCK: Schematic_Car_Main (U1.21 U2.5), Schematic_Car_Secondary (TP_SPCK.1)
STAT0: Schematic_Car_Main (R9.2 U1.37), Schematic_Car_Secondary (TP_STAT0.1)